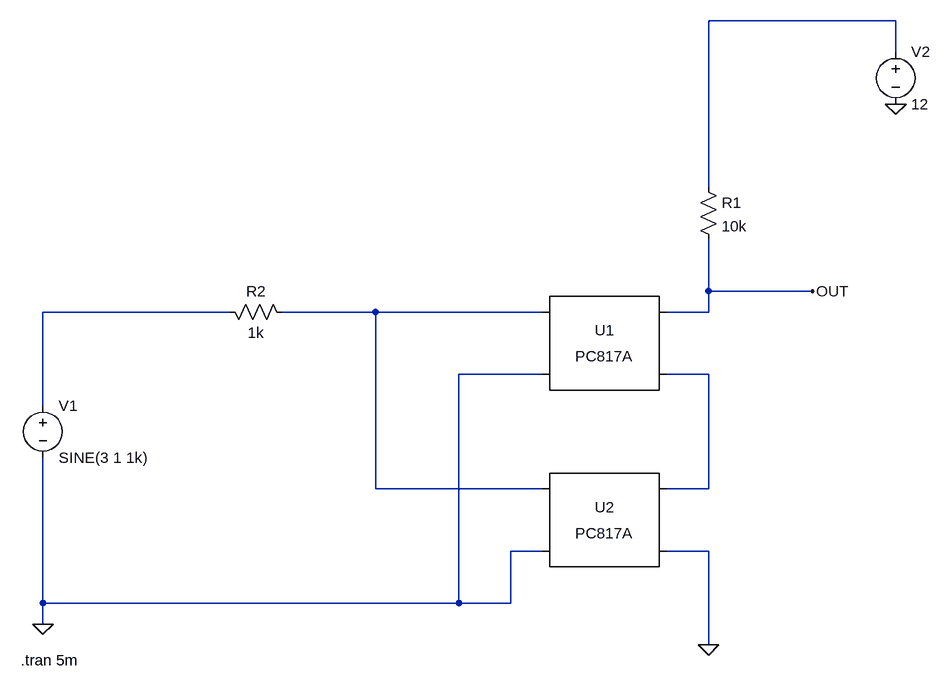
[diagram p0: schematic opto_analog.asc]
opto_analog.asc, the LTspice schematic file:
Version 4
SHEET 1 880 680
WIRE 656 -368 368 -368
WIRE 656 -320 656 -368
WIRE 368 -112 368 -368
WIRE 368 48 368 -32
WIRE 528 48 368 48
WIRE -368 80 -656 80
WIRE -144 80 -288 80
WIRE 112 80 -144 80
WIRE 368 80 368 48
WIRE 368 80 304 80
WIRE 112 176 -16 176
WIRE 368 176 304 176
WIRE -656 224 -656 80
WIRE -144 352 -144 80
WIRE 112 352 -144 352
WIRE 368 352 368 176
WIRE 368 352 304 352
WIRE 112 448 64 448
WIRE 368 448 304 448
WIRE -656 528 -656 304
WIRE -16 528 -16 176
WIRE -16 528 -656 528
WIRE 64 528 64 448
WIRE 64 528 -16 528
WIRE -656 560 -656 528
WIRE 368 592 368 448
FLAG -656 560 0
FLAG 656 -240 0
FLAG 368 592 0
FLAG 528 48 OUT
SYMBOL Optos\\PC817A 208 128 R0
SYMATTR InstName U1
SYMBOL Optos\\PC817A 208 400 M0
SYMATTR InstName U2
SYMBOL res 352 -128 R0
SYMATTR InstName R1
SYMATTR Value 10k
SYMBOL res -384 64 M90
WINDOW 0 0 56 VBottom 2
WINDOW 3 32 56 VTop 2
SYMATTR InstName R2
SYMATTR Value 1k
SYMBOL voltage -656 208 R0
WINDOW 123 0 0 Left 0
WINDOW 39 0 0 Left 0
SYMATTR InstName V1
SYMATTR Value SINE(3 1 1k)
SYMBOL voltage 656 -336 R0
WINDOW 123 0 0 Left 0
WINDOW 39 0 0 Left 0
SYMATTR InstName V2
SYMATTR Value 12
TEXT -690 616 Left 2 !.tran 5m

The netlist it stands for:
* opto_analog.asc
XU1 N003 0 OUT N004 PC817 Igain=1m
XU2 N004 0 N003 0 PC817 Igain=1m
R1 N001 OUT 10k
R2 N002 N003 1k
V1 N002 0 SINE(3 1 1k)
V2 N001 0 12
.tran 5m
.lib PC817.sub
.backanno
.end